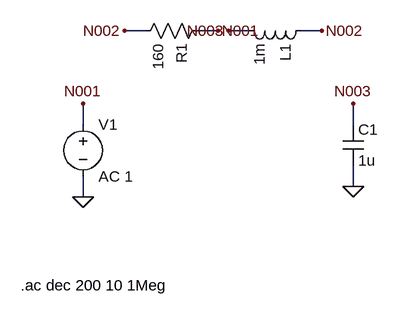
[diagram p0: schematic rlc_ac.asc]
rlc_ac.asc, the LTspice schematic file:
Version 4
SHEET 1 896 680
WIRE 160 352 160 384
WIRE 576 336 576 368
WIRE 160 272 160 240
WIRE 336 128 368 128
WIRE 256 128 224 128
WIRE 496 128 528 128
WIRE 416 128 384 128
WIRE 576 272 576 240
FLAG 160 384 0
FLAG 576 368 0
FLAG 160 240 N001
FLAG 368 128 N001
FLAG 224 128 N002
FLAG 528 128 N002
FLAG 384 128 N003
FLAG 576 240 N003
SYMBOL voltage 160 256 R0
SYMATTR InstName V1
SYMATTR Value AC 1
SYMBOL res 352 112 R90
SYMATTR InstName R1
SYMATTR Value 160
SYMBOL ind 512 112 R90
SYMATTR InstName L1
SYMATTR Value 1m
SYMBOL cap 560 272 R0
SYMATTR InstName C1
SYMATTR Value 1u
TEXT 64 520 Left 2 !.ac dec 200 10 1Meg

The netlist it stands for:
* rlc_ac.asc
V1 N001 0 AC 1
R1 N001 N002 160
L1 N002 N003 1m
C1 N003 0 1u
.ac dec 200 10 1Meg
.backanno
.end